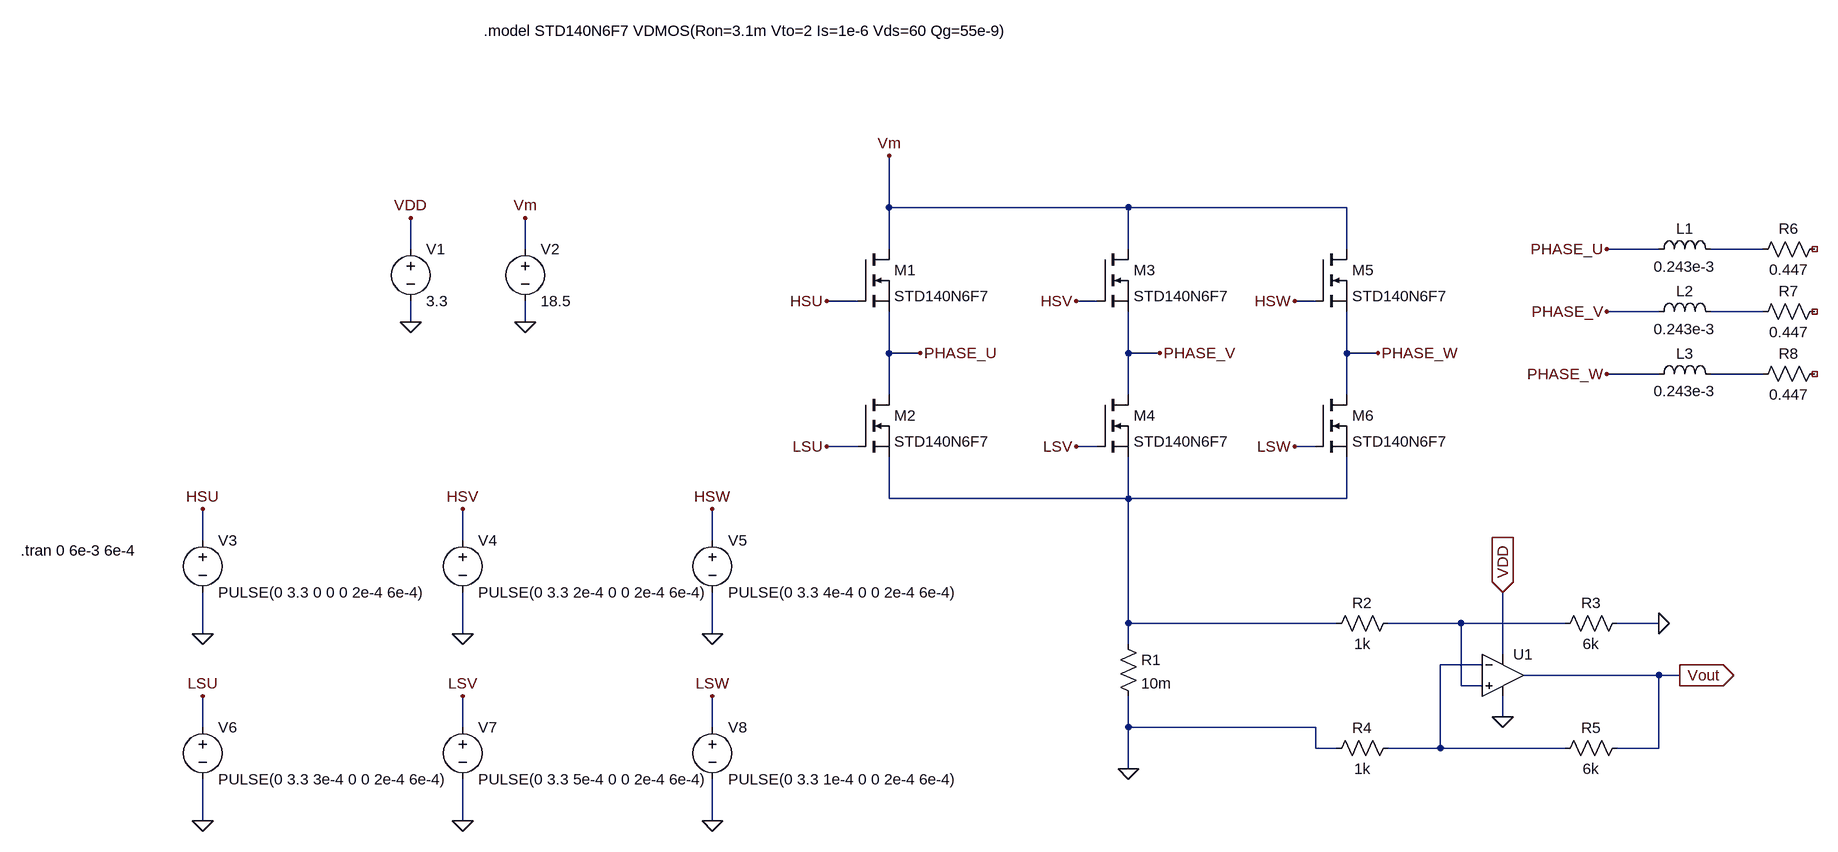
[diagram p0: schematic BLDC_Sim.asc]
BLDC_Sim.asc, the LTspice schematic file:
Version 4
SHEET 1 2248 788
WIRE 112 -176 112 -256
WIRE 480 -176 112 -176
WIRE 816 -176 480 -176
WIRE -624 -112 -624 -160
WIRE -448 -112 -448 -160
WIRE 112 -112 112 -176
WIRE 480 -112 480 -176
WIRE 816 -112 816 -176
WIRE 1296 -112 1216 -112
WIRE 1456 -112 1376 -112
WIRE 64 -32 16 -32
WIRE 432 -32 400 -32
WIRE 768 -32 736 -32
WIRE 1296 -16 1216 -16
WIRE 1456 -16 1376 -16
WIRE -624 0 -624 -32
WIRE -448 0 -448 -32
WIRE 112 48 112 -16
WIRE 160 48 112 48
WIRE 480 48 480 -16
WIRE 528 48 480 48
WIRE 816 48 816 -16
WIRE 864 48 816 48
WIRE 1296 80 1216 80
WIRE 1456 80 1376 80
WIRE 112 112 112 48
WIRE 480 112 480 48
WIRE 816 112 816 48
WIRE 64 192 16 192
WIRE 432 192 400 192
WIRE 768 192 736 192
WIRE 112 272 112 208
WIRE 480 272 480 208
WIRE 480 272 112 272
WIRE 816 272 816 208
WIRE 816 272 480 272
WIRE -944 336 -944 288
WIRE -544 336 -544 288
WIRE -160 336 -160 288
WIRE 480 464 480 272
WIRE 800 464 480 464
WIRE 992 464 880 464
WIRE 1152 464 992 464
WIRE 1296 464 1232 464
WIRE -944 480 -944 416
WIRE -544 480 -544 416
WIRE -160 480 -160 416
WIRE 480 496 480 464
WIRE 1056 512 1056 416
WIRE 1024 528 960 528
WIRE 1296 544 1088 544
WIRE 1328 544 1296 544
WIRE 992 560 992 464
WIRE 1024 560 992 560
WIRE 1056 608 1056 576
WIRE -944 624 -944 576
WIRE -544 624 -544 576
WIRE -160 624 -160 576
WIRE 480 624 480 576
WIRE 768 624 480 624
WIRE 768 656 768 624
WIRE 800 656 768 656
WIRE 960 656 960 528
WIRE 960 656 880 656
WIRE 1152 656 960 656
WIRE 1296 656 1296 544
WIRE 1296 656 1232 656
WIRE 480 688 480 624
WIRE -944 768 -944 704
WIRE -544 768 -544 704
WIRE -160 768 -160 704
FLAG -624 0 0
FLAG -624 -160 VDD
FLAG -944 288 HSU
FLAG -944 480 0
FLAG 160 48 PHASE_U
FLAG 528 48 PHASE_V
FLAG 864 48 PHASE_W
FLAG -448 0 0
FLAG -448 -160 Vm
FLAG 112 -256 Vm
FLAG -544 288 HSV
FLAG -544 480 0
FLAG -160 288 HSW
FLAG -160 480 0
FLAG 480 688 0
FLAG -944 576 LSU
FLAG -944 768 0
FLAG -544 576 LSV
FLAG -544 768 0
FLAG -160 576 LSW
FLAG -160 768 0
FLAG 16 -32 HSU
FLAG 16 192 LSU
FLAG 400 -32 HSV
FLAG 400 192 LSV
FLAG 736 -32 HSW
FLAG 736 192 LSW
FLAG 1056 416 VDD
IOPIN 1056 416 In
FLAG 1056 608 0
FLAG 1296 464 0
FLAG 1328 544 Vout
IOPIN 1328 544 Out
FLAG 1216 -112 PHASE_U
FLAG 1216 -16 PHASE_V
FLAG 1216 80 PHASE_W
SYMBOL voltage -624 -128 R0
WINDOW 123 0 0 Left 0
WINDOW 39 0 0 Left 0
SYMATTR InstName V1
SYMATTR Value 3.3
SYMBOL nmos 64 -112 R0
SYMATTR InstName M1
SYMATTR Value STD140N6F7
SYMBOL voltage -944 320 R0
WINDOW 123 0 0 Left 0
WINDOW 39 0 0 Left 0
SYMATTR InstName V3
SYMATTR Value PULSE(0 3.3 0 0 0 2e-4 6e-4)
SYMBOL nmos 64 112 R0
SYMATTR InstName M2
SYMATTR Value STD140N6F7
SYMBOL nmos 432 -112 R0
SYMATTR InstName M3
SYMATTR Value STD140N6F7
SYMBOL nmos 432 112 R0
SYMATTR InstName M4
SYMATTR Value STD140N6F7
SYMBOL nmos 768 -112 R0
SYMATTR InstName M5
SYMATTR Value STD140N6F7
SYMBOL nmos 768 112 R0
SYMATTR InstName M6
SYMATTR Value STD140N6F7
SYMBOL voltage -448 -128 R0
WINDOW 123 0 0 Left 0
WINDOW 39 0 0 Left 0
SYMATTR InstName V2
SYMATTR Value 18.5
SYMBOL voltage -544 320 R0
WINDOW 123 0 0 Left 0
WINDOW 39 0 0 Left 0
SYMATTR InstName V4
SYMATTR Value PULSE(0 3.3 2e-4 0 0 2e-4 6e-4)
SYMBOL voltage -160 320 R0
WINDOW 123 0 0 Left 0
WINDOW 39 0 0 Left 0
SYMATTR InstName V5
SYMATTR Value PULSE(0 3.3 4e-4 0 0 2e-4 6e-4)
SYMBOL res 464 480 R0
SYMATTR InstName R1
SYMATTR Value 10m
SYMBOL voltage -944 608 R0
WINDOW 123 0 0 Left 0
WINDOW 39 0 0 Left 0
SYMATTR InstName V6
SYMATTR Value PULSE(0 3.3 3e-4 0 0 2e-4 6e-4)
SYMBOL voltage -544 608 R0
WINDOW 123 0 0 Left 0
WINDOW 39 0 0 Left 0
SYMATTR InstName V7
SYMATTR Value PULSE(0 3.3 5e-4 0 0 2e-4 6e-4)
SYMBOL voltage -160 608 R0
WINDOW 123 0 0 Left 0
WINDOW 39 0 0 Left 0
SYMATTR InstName V8
SYMATTR Value PULSE(0 3.3 1e-4 0 0 2e-4 6e-4)
SYMBOL OpAmps\\UniversalOpAmp2 1056 544 R0
SYMATTR InstName U1
SYMATTR Value2 Avol=3.1623e4 GBW=18Meg Slew=10Meg
SYMATTR SpiceLine Ilimit=18m Rail=0 Vos=0
SYMBOL res 896 448 R90
WINDOW 0 0 56 VBottom 2
WINDOW 3 32 56 VTop 2
SYMATTR InstName R2
SYMATTR Value 1k
SYMBOL res 1248 448 R90
WINDOW 0 0 56 VBottom 2
WINDOW 3 32 56 VTop 2
SYMATTR InstName R3
SYMATTR Value 6k
SYMBOL res 896 640 R90
WINDOW 0 0 56 VBottom 2
WINDOW 3 32 56 VTop 2
SYMATTR InstName R4
SYMATTR Value 1k
SYMBOL res 1248 640 R90
WINDOW 0 0 56 VBottom 2
WINDOW 3 32 56 VTop 2
SYMATTR InstName R5
SYMATTR Value 6k
SYMBOL ind 1280 -96 R270
WINDOW 0 32 56 VTop 2
WINDOW 3 5 56 VBottom 2
SYMATTR InstName L1
SYMATTR Value 0.243e-3
SYMBOL ind 1280 0 R270
WINDOW 0 32 56 VTop 2
WINDOW 3 5 56 VBottom 2
SYMATTR InstName L2
SYMATTR Value 0.243e-3
SYMBOL ind 1280 96 R270
WINDOW 0 32 56 VTop 2
WINDOW 3 5 56 VBottom 2
SYMATTR InstName L3
SYMATTR Value 0.243e-3
SYMBOL res 1552 -128 R90
WINDOW 0 0 56 VBottom 2
WINDOW 3 32 56 VTop 2
SYMATTR InstName R6
SYMATTR Value 0.447
SYMBOL res 1552 -32 R90
WINDOW 0 0 56 VBottom 2
WINDOW 3 32 56 VTop 2
SYMATTR InstName R7
SYMATTR Value 0.447
SYMBOL res 1552 64 R90
WINDOW 0 0 56 VBottom 2
WINDOW 3 32 56 VTop 2
SYMATTR InstName R8
SYMATTR Value 0.447
TEXT -512 -448 Left 2 !.model STD140N6F7 VDMOS(Ron=3.1m Vto=2 Is=1e-6 Vds=60 Qg=55e-9)
TEXT -1224 352 Left 2 !.tran 0 6e-3 6e-4

The netlist it stands for:
* BLDC_Sim.asc
V1 VDD 0 3.3
M1 Vm HSU PHASE_U PHASE_U STD140N6F7
V3 HSU 0 PULSE(0 3.3 0 0 0 2e-4 6e-4)
M2 PHASE_U LSU N004 N004 STD140N6F7
M3 Vm HSV PHASE_V PHASE_V STD140N6F7
M4 PHASE_V LSV N004 N004 STD140N6F7
M5 Vm HSW PHASE_W PHASE_W STD140N6F7
M6 PHASE_W LSW N004 N004 STD140N6F7
V2 Vm 0 18.5
V4 HSV 0 PULSE(0 3.3 2e-4 0 0 2e-4 6e-4)
V5 HSW 0 PULSE(0 3.3 4e-4 0 0 2e-4 6e-4)
R1 N004 0 10m
V6 LSU 0 PULSE(0 3.3 3e-4 0 0 2e-4 6e-4)
V7 LSV 0 PULSE(0 3.3 5e-4 0 0 2e-4 6e-4)
V8 LSW 0 PULSE(0 3.3 1e-4 0 0 2e-4 6e-4)
XU1 N005 N006 VDD 0 Vout level2 Avol=3.1623e4 GBW=18Meg Slew=10Meg Ilimit=18m Rail=0 Vos=0 En=0 Enk=0 In=0 Ink=0 Rin=500Meg  ; pins In+ In- V+ V- OUT
R2 N005 N004 1k
R3 0 N005 6k
R4 N006 0 1k
R5 Vout N006 6k
L1 PHASE_U N001 0.243e-3
L2 PHASE_V N002 0.243e-3
L3 PHASE_W N003 0.243e-3
R6 NC_01 N001 0.447
R7 NC_02 N002 0.447
R8 NC_03 N003 0.447
.model NMOS NMOS
.model PMOS PMOS
.lib standard.mos
.model STD140N6F7 VDMOS(Ron=3.1m Vto=2 Is=1e-6 Vds=60 Qg=55e-9)
.tran 0 6e-3 6e-4
.lib UniversalOpAmp2.lib
.backanno
.end